# EasyEDA Pro project ran-pang-airlink-86231b34.epro, board PCB2
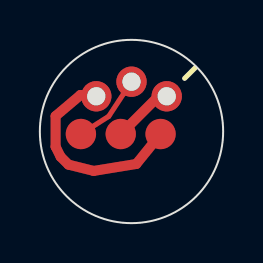
[diagram p11: board, top side]
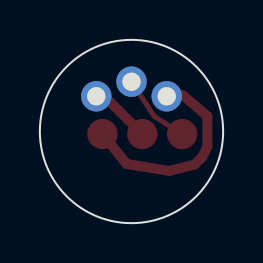
[diagram p12: board, bottom side, seen from below]

Outline 9.2 x 9.2 mm; copper layers: Top Layer, Bottom Layer. Coordinates in mm from the lower left corner of the outline.
Outline path: circle c4.6,4.6 r4.6
Stack: Top Layer 0.035mm / Dielectric1 1.51mm FR4 er 4.5 / Bottom Layer 0.035mm

## Design rules (mm)
spacing copperThickness1oz (default): track to track 0.102, other pairs 0.152 to 0.3
spacing copperThickness2oz: track to track 0.203, other pairs 0.152 to 0.3
track width copperThickness1oz (default): min 0.127, default 0.254, max 2.54
track width copperThickness2oz: min 0.203, default 0.254, max 2.54
differential pair differentialPair (default): width min 0.127, default 0.254, max 2.54; gap min 0.152, default 0.152

## Placement (name value [footprint] x y rotation side)
NOREF  -  [Pad_e17]  4.06 4.47 0 top
NOREF#2  -  [Pad_e15]  6.37 6.37 225 top
NOREF#3  -  [Pad_e16]  2.06 4.47 0 top
NOREF#4  -  [Pad_e13]  2.83 6.37 225 top
NOREF#5  -  [Pad_e18]  6.06 4.47 0 top
NOREF#6  -  [Pad_e14]  4.6 7.1 225 top

## Footprints (pads in the part's own frame, mm; a bottom-side part is the same pattern mirrored in y, then rotated)
Pad_e13
  round 1.524 hole 0.914: 2(0,0)
Pad_e14
  round 1.524 hole 0.914: 1(0,0)
Pad_e15
  round 1.524 hole 0.914: 0(0,0)
Pad_e16
  round 1.524 smd: 1(0,0)
Pad_e17
  round 1.524 smd: 2(0,0)
Pad_e18
  round 1.524 smd: 3(0,0)

## Nets
VBAT: NOREF.2 NOREF#2.0
WIRED_POW: NOREF#3.1 NOREF#6.1
WIRELESS_POW: NOREF#4.2 NOREF#5.3

## Routing (per net, layer and track width the routed paths; a pad name or vN(x,y) marks a point on that pad's centre or on a via; arc(x,y) is an arc through that point)
VBAT: length 3.1
  Top Layer w0.5: NOREF.2 5.95,6.37 NOREF#2.0
WIRED_POW: length 3.7
  Top Layer w0.254: NOREF#3.1 3.46,5.36 NOREF#6.1
WIRELESS_POW: length 10.5
  Top Layer w0.5: NOREF#5.3 4.84,2.97 2.7,2.62 1.44,2.94 1.04,3.33 0.79,3.84 0.79,5.37 2.04,6.43 NOREF#4.2
